# Altium schematic sheet 200_DC-DC.SchDoc: DC-DC Convertion stages
size A3; Date: xxxxxx; DrawnBy: H.Y.Pabón; Revision: V1R0; SheetNumber: 3; SheetTotal: 4
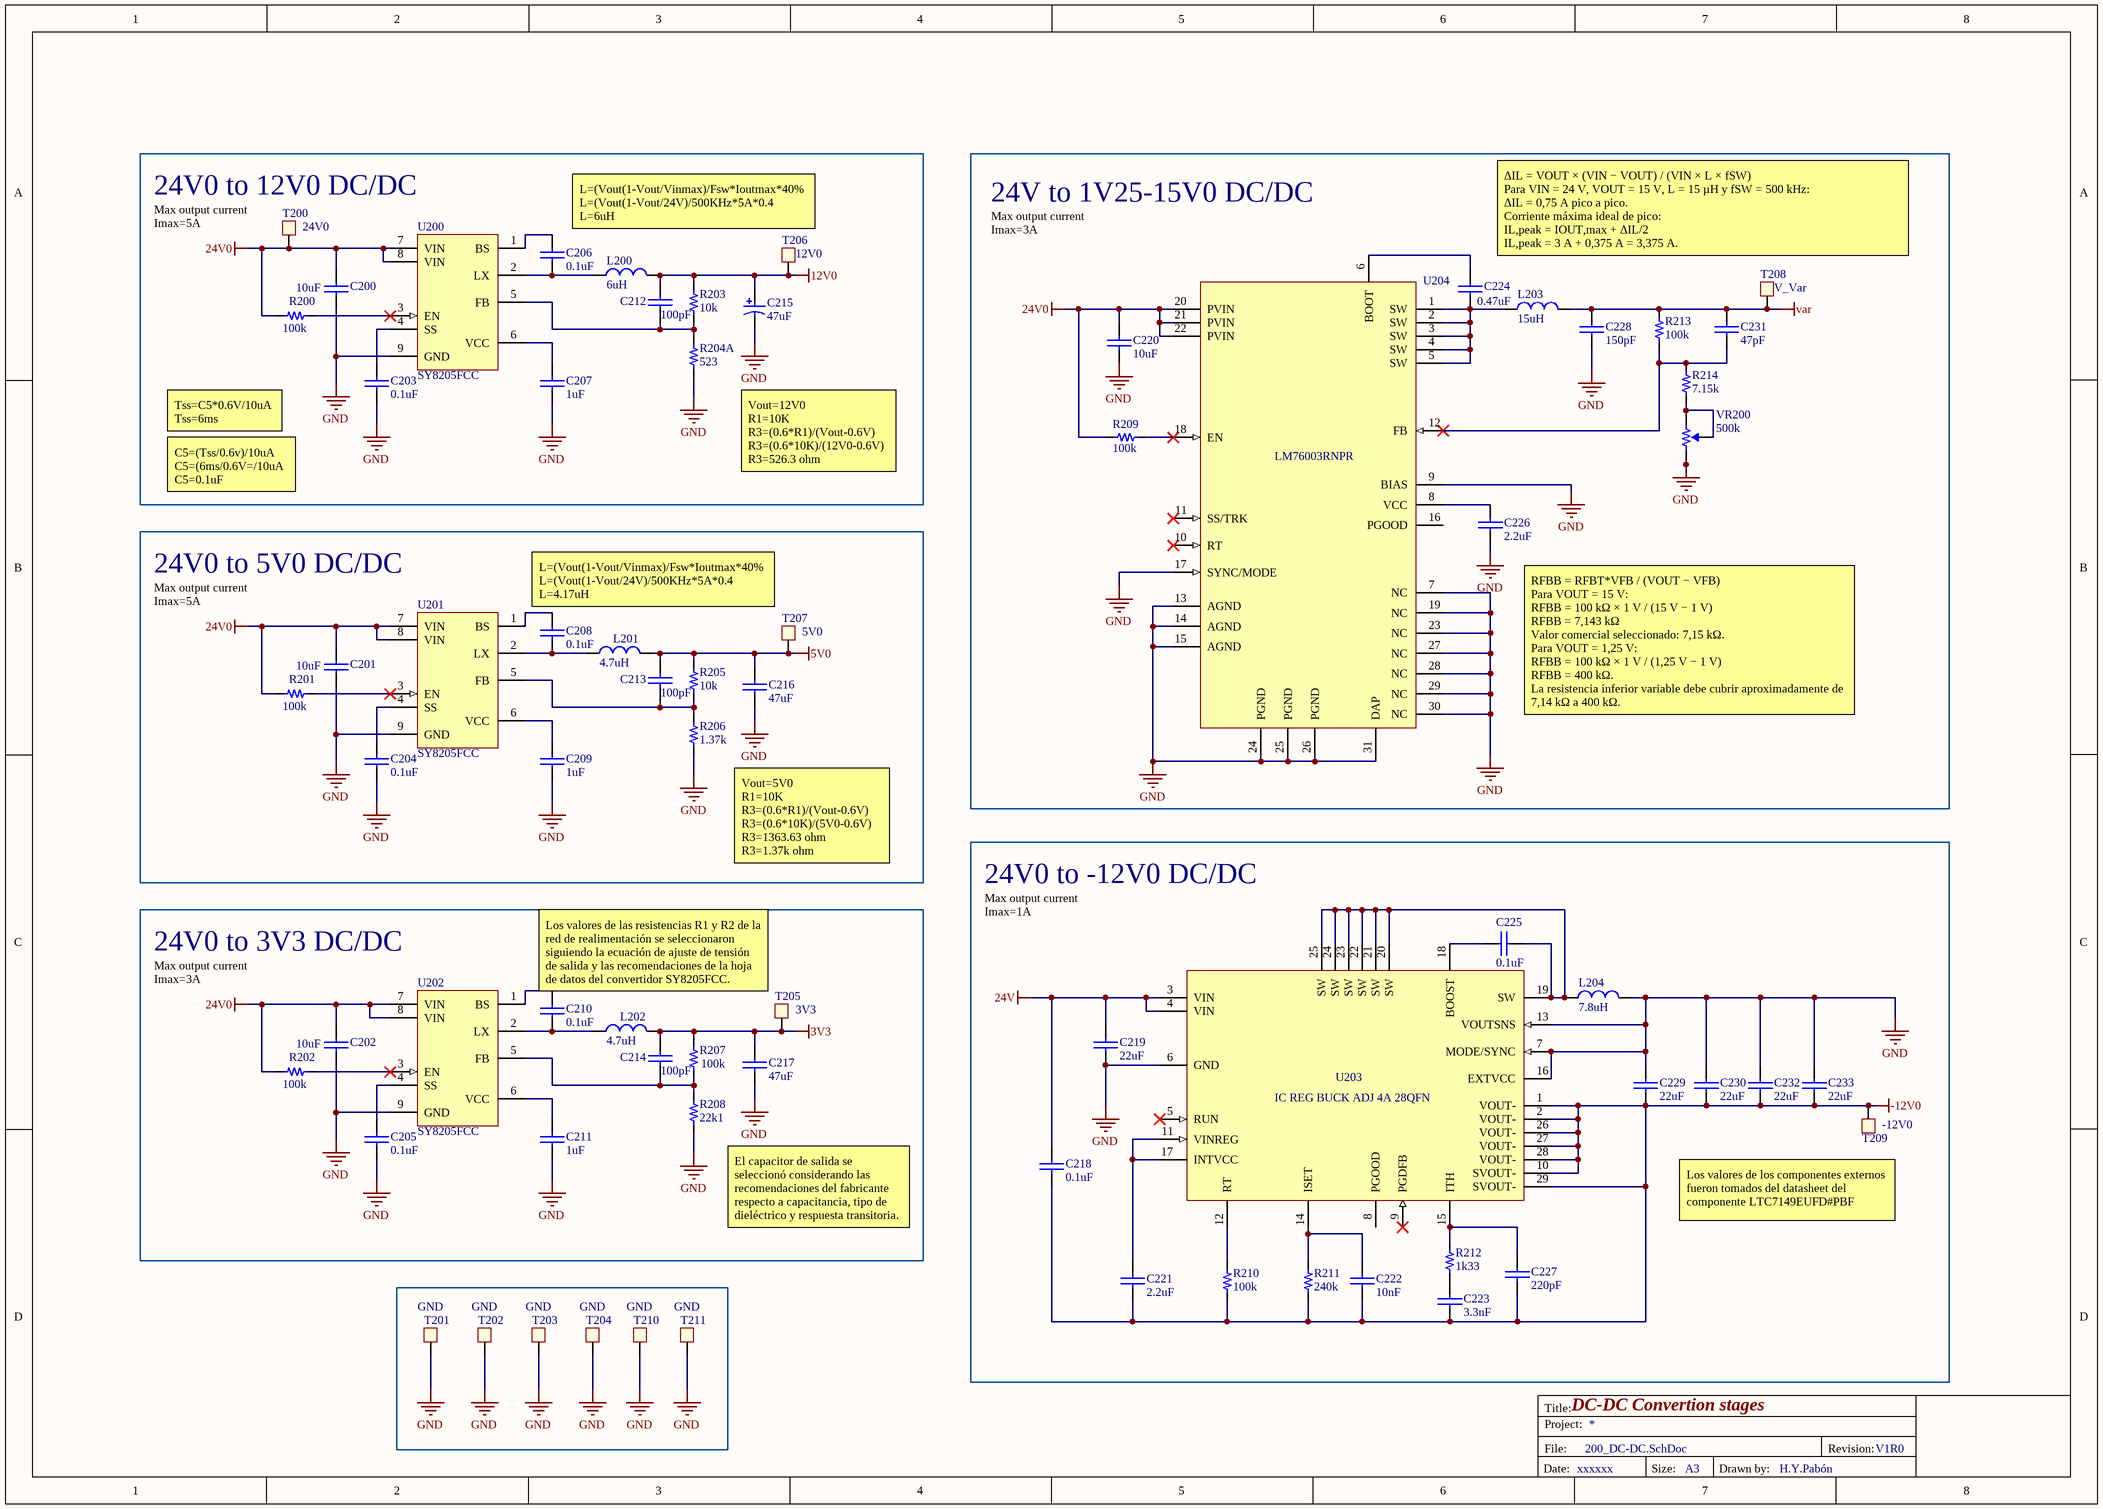
[diagram p0: 200_DC-DC.SchDoc]

## Parts
C200  value 10uF  [1206]  (hidden comment: 10uF 50V)
C201  value 10uF  [1206]  (hidden comment: 10uF 50V)
C202  value 10uF  [1206]  (hidden comment: 10uF 50V)
C203  value 0.1uF  [0603]  (hidden comment: 100nF 25V)
C204  value 0.1uF  [0603]  (hidden comment: 100nF 25V)
C205  value 0.1uF  [0603]  (hidden comment: 100nF 25V)
C206  value 0.1uF  [0603]  (hidden comment: 100nF 25V)
C207  value 1uF  [0805]  (hidden comment: 1uF 25V)
C208  value 0.1uF  [0603]  (hidden comment: 100nF 25V)
C209  value 1uF  [0805]  (hidden comment: 1uF 25V)
C210  value 0.1uF  [0603]  (hidden comment: 100nF 25V)
C211  value 1uF  [0805]  (hidden comment: 1uF 25V)
C212  value 100pF  [0603]  (hidden comment: 100pF 550)
C213  value 100pF  [0603]  (hidden comment: 100pF 550)
C214  value 100pF  [0603]  (hidden comment: 100pF 550)
C215  value 47uF  [RADIAL-CAN-SMD_Diax5mm_Hx6.1mm]  (hidden comment: 47uF 35V)
C216  value 47uF  [1210]  (hidden comment: 47uF 1210)
C217  value 47uF  [1210]  (hidden comment: 47uF 1210)
C218  value 0.1uF  [0402]  (hidden comment: 0.1uF 50V)
C219  value 22uF  [0805]  (hidden comment: 22uF 25V)
C220  value 10uF  [1206]  (hidden comment: 10uF 50V)
C221  2.2uF  [0402]
C222  value 10nF  [0603]  (hidden comment: 10nF 50V)
C223  value 3.3nF  [Cap_3.3nF_25V_X7R0603]  (hidden comment: 3.3nF_25V)
C224  value 0.47uF  [0603]  (hidden comment: 0.47uF 25V)
C225  value 0.1uF  [0402]  (hidden comment: 0.1uF 50V)
C226  2.2uF  [0402]
C227  value 220pF  [0402_RF]  (hidden comment: 220pF 50V)
C228  value 150pF  [0603]  (hidden comment: 150pF 50V)
C229  value 22uF  [1210]  (hidden comment: 22uF 25V)
C230  value 22uF  [1210]  (hidden comment: 22uF 25V)
C231  value 47pF  [0603]  (hidden comment: 47pF 16V)
C232  value 22uF  [1210]  (hidden comment: 22uF 25V)
C233  value 22uF  [1210]  (hidden comment: 22uF 25V)
L200  value 6uH  [L_6uH_9.5A_SMD,13x12.8mm]  (hidden comment: 6uH_9.5A)
L201  value 4.7uH  [L_4.7uH_7A_SMD]  (hidden comment: 4.7uH_5A)
L202  value 4.7uH  [L_4.7uH_7A_SMD]  (hidden comment: 4.7uH_7A)
L203  value 15uH  [L_15uH_4.5A_SMD,12.3x12.3mm]  (hidden comment: SMDRI127-150MT)
L204  value 7.8uH  [L_7.8uH_8A_SMD,10.5x10.2mm]  (hidden comment: 7.8uH_8A)
R200  value 100k  [0402]  (hidden comment: 100K 1/16W)
R201  value 100k  [0402]  (hidden comment: 100K 1/16W)
R202  value 100k  [0402]  (hidden comment: 100K 1/16W)
R203  value 10k  [0402]  (hidden comment: 10k 1/16W)
R204  value 523  [Res_523_SMD0805_130mW]  (hidden comment: 523 OHM_130mW)  (part A of 2)
R205  value 10k  [0402]  (hidden comment: 10k 1/16W)
R206  value 1.37k  [Res_1.37k_0402_100mW]  (hidden comment: 1.37k_100mW)
R207  value 100k  [0402]  (hidden comment: 100K 1/16W)
R208  value 22k1  [0603]  (hidden comment: 22k1 1/10W)
R209  value 100k  [0805]  (hidden comment: 100k 1/8W)
R210  value 100k  [0402]  (hidden comment: 100K 1/16W)
R211  value 240k  [0603]  (hidden comment: 240k 1/10W)
R212  value 1k33  [0603]  (hidden comment: 1k33 1/10W)
R213  value 100k  [0603]  (hidden comment: 100k 1/10W)
R214  value 7.15k  [RES 7.15k_SMD-0603]  (hidden comment: MCR03EZPFX7151)
T200  24V0  [TP_TH_30mil]  (no BOM)
T201  GND  [TP_TH_30mil]  (no BOM)
T202  GND  [TP_TH_30mil]  (no BOM)
T203  GND  [TP_TH_30mil]  (no BOM)
T204  GND  [TP_TH_30mil]  (no BOM)
T205  3V3  [TP_TH_30mil]  (no BOM)
T206  12V0  [TP_TH_30mil]  (no BOM)
T207  5V0  [TP_TH_30mil]  (no BOM)
T208  V_Var  [TP_TH_30mil]  (no BOM)
T209  -12V0  [TP_TH_30mil]  (no BOM)
T210  GND  [TP_TH_30mil]  (no BOM)
T211  GND  [TP_TH_30mil]  (no BOM)
U200  SY8205FCC  [SOIC127P600X140_HS-9N]
U201  SY8205FCC  [SOIC127P600X140_HS-9N]
U202  SY8205FCC  [SOIC127P600X140_HS-9N]
U203  IC REG BUCK ADJ 4A 28QFN  [IC REG BUCK ADJ 4A 28QFN]
U204  LM76003RNPR  [DCDC_ADJ_3.5A_WQFN-30-EP(4x6)]
VR200  value 500k  [Pot_3x1_5mm_TH]  (hidden comment: 500k 1/5W)

## Blocks framed on the sheet
24V0 to 12V0 DC/DC: C200 C203 C206 C207 C212 C215 L200 R200 R203 R204 T200 T206 U200
24V to 1V25-15V0 DC/DC: C220 C224 C226 C228 C231 L203 R209 R213 R214 T208 U204 VR200
24V0 to 5V0 DC/DC: C201 C204 C208 C209 C213 C216 L201 R201 R205 R206 T207 U201
24V0 to -12V0 DC/DC: C218 C219 C221-C223 C225 C227 C229 C230 C232 C233 L204 R210-R212 T209 U203
24V0 to 3V3 DC/DC: C202 C205 C210 C211 C214 C217 L202 R202 R207 R208 T205 U202

## Nets
3V3: C214.1 C217.1 L202.2 R207.2 T205.1
5V0: C213.1 C216.1 L201.2 R205.2 T207.1
12V0: C212.1 C215.1 L200.2 R203.2 T206.1
24V: C218.1 C219.1 U203.3(VIN) U203.4(VIN)
24V0: C200.1 C201.1 C202.1 C220.1 R200.1 R201.1 R202.1 R209.2 T200.1 U200.7(VIN) U200.8(VIN) U201.7(VIN) U201.8(VIN) U202.7(VIN) U202.8(VIN) U204.20(PVIN) U204.21(PVIN) U204.22(PVIN)
-12V0: C218.2 C221.2 C222.2 C223.2 C227.2 C229.2 C230.2 C232.2 C233.2 R210.1 R211.1 T209.1 U203.1(VOUT-) U203.2(VOUT-) U203.10(SVOUT-) U203.26(VOUT-) U203.27(VOUT-) U203.28(VOUT-) U203.29(SVOUT-)
GND: C200.2 C201.2 C202.2 C203.2 C204.2 C205.2 C207.2 C209.2 C211.2 C215.2 C216.2 C217.2 C219.2 C220.2 C226.2 C228.2 C229.1 C230.1 C232.1 C233.1 L204.2 R204.1 R206.1 R208.1 T201.1 T202.1 T203.1 T204.1 T210.1 T211.1 U200.9(GND) U201.9(GND) U202.9(GND) U203.6(GND) U203.7(MODE/SYNC) U203.13(VOUTSNS) U203.16(EXTVCC) U204.7(NC) U204.9(BIAS) U204.13(AGND) U204.14(AGND) U204.15(AGND) U204.17(SYNC/MODE) U204.19(NC) U204.23(NC) U204.24(PGND) U204.25(PGND) U204.26(PGND) U204.27(NC) U204.28(NC) U204.29(NC) U204.30(NC) U204.31(DAP) VR200.3
var: C228.1 C231.1 L203.2 R213.2 T208.1
NetC203_1: C203.1 U200.4(SS)
NetC204_1: C204.1 U201.4(SS)
NetC205_1: C205.1 U202.4(SS)
NetC206_1: C206.1 U200.1(BS)
NetC206_2: C206.2 L200.1 U200.2(LX)
NetC207_1: C207.1 U200.6(VCC)
NetC208_1: C208.1 U201.1(BS)
NetC208_2: C208.2 L201.1 U201.2(LX)
NetC209_1: C209.1 U201.6(VCC)
NetC210_1: C210.1 U202.1(BS)
NetC210_2: C210.2 L202.1 U202.2(LX)
NetC211_1: C211.1 U202.6(VCC)
NetC212_2: C212.2 R203.1 R204.2 U200.5(FB)
NetC213_2: C213.2 R205.1 R206.2 U201.5(FB)
NetC214_2: C214.2 R207.1 R208.2 U202.5(FB)
NetC221_1: C221.1 U203.11(VINREG) U203.17(INTVCC)
NetC222_1: C222.1 R211.2 U203.14(ISET)
NetC223_1: C223.1 R212.1
NetC224_1: C224.1 L203.1 U204.1(SW) U204.2(SW) U204.3(SW) U204.4(SW) U204.5(SW)
NetC224_2: C224.2 U204.6(BOOT)
NetC225_1: C225.1 U203.18(BOOST)
NetC225_2: C225.2 L204.1 U203.19(SW) U203.20(SW) U203.21(SW) U203.22(SW) U203.23(SW) U203.24(SW) U203.25(SW)
NetC226_1: C226.1 U204.8(VCC)
NetC227_1: C227.1 R212.2 U203.15(ITH)
NetC231_2: C231.2 R213.1 R214.2 U204.12(FB)
NetR200_2: R200.2 U200.3(EN)
NetR201_2: R201.2 U201.3(EN)
NetR202_2: R202.2 U202.3(EN)
NetR209_1: R209.1 U204.18(EN)
NetR210_2: R210.2 U203.12(RT)
NetR214_1: R214.1 VR200.1 VR200.2

Not connected (* = marked no-connect by the designer): U203 5(RUN)* 8(PGOOD) 9(PGDFB)*; U204 10(RT)* 11(SS/TRK)* 16(PGOOD)

## Notes on the sheet
- (near T200) Max output current
  Imax=5A
- L=(Vout(1-Vout/Vinmax)/Fsw*Ioutmax*40%
  L=(Vout(1-Vout/24V)/500KHz*5A*0.4
  L=6uH
- Max output current
  Imax=3A
- ΔIL = VOUT × (VIN − VOUT) / (VIN × L × fSW)
  Para VIN = 24 V, VOUT = 15 V, L = 15 µH y fSW = 500 kHz:
  ΔIL = 0,75 A pico a pico.
  Corriente máxima ideal de pico:
  IL,peak = IOUT,max + ΔIL/2
  IL,peak = 3 A + 0,375 A = 3,375 A.
- Tss=C5*0.6V/10uA
  Tss=6ms
  Css=0.1uF
- C5=(Tss/0.6v)/10uA
  C5=(6ms/0.6V=/10uA
  C5=0.1uF
- Vout=12V0
  R1=10K
  R3=(0.6*R1)/(Vout-0.6V)
  R3=(0.6*10K)/(12V0-0.6V)
  R3=526.3 ohm
- Max output current
  Imax=5A
- (near C208) L=(Vout(1-Vout/Vinmax)/Fsw*Ioutmax*40%
  L=(Vout(1-Vout/24V)/500KHz*5A*0.4
  L=4.17uH
- (near C226) RFBB = RFBT*VFB / (VOUT − VFB)
  Para VOUT = 15 V:
  RFBB = 100 kΩ × 1 V / (15 V − 1 V)
  RFBB = 7,143 kΩ
  Valor comercial seleccionado: 7,15 kΩ.
  Para VOUT = 1,25 V:
  RFBB = 100 kΩ × 1 V / (1,25 V − 1 V)
  RFBB = 400 kΩ.
  La resistencia inferior variable debe cubrir aproximadamente de 7,14 kΩ a 400 kΩ.
- Vout=5V0
  R1=10K
  R3=(0.6*R1)/(Vout-0.6V)
  R3=(0.6*10K)/(5V0-0.6V)
  R3=1363.63 ohm
  R3=1.37k ohm
- Max output current
  Imax=1A
- (near C210) Los valores de las resistencias R1 y R2 de la red de realimentación se seleccionaron siguiendo la ecuación de ajuste de tensión de salida y las recomendaciones de la hoja de datos del convertidor SY8205FCC.
- (near R208) El capacitor de salida se seleccionó considerando las recomendaciones del fabricante respecto a capacitancia, tipo de dieléctrico y respuesta transitoria.
- (near T209) Los valores de los componentes externos fueron tomados del datasheet del componente LTC7149EUFD#PBF
- Title:
- Project:
- File:
- Revision:
- Date:
- Size:
- A3
- Drawn by:

## Library data of the parts
C200-C202 C220 = Cap_10uF_1206_50V: CAP CER 10UF 50V X5R 1206; Manufacturer: Murata Electronics North America; Manufacturer Part Number: GRT31CR61H106ME01L; Last modified by: J.Jaramillo; Last modified date: 20240309; ComponentLink1Description: Digi-Key; ComponentLink1URL: https://www.digikey.com/product-detail/en/murata-electronics-north-america/GRT31CR61H106ME01L/490-12457-1-ND/5417158; Supplier 1: Digi-Key; Supplier Part Number 1: 490-12457-1-ND
C203-C206 C208 C210 = Cap_0.1uF_0603_25V: CAP CER 0.1UF 25V X7R 0603; Manufacturer: TDK; Manufacturer Part Number: CGA3E2X7R1E104K080AA; Last modified by: J.Jaramillo; Last modified date: 20240309; ComponentLink1Description: Digi-key; ComponentLink1URL: https://www.digikey.com/en/products/detail/tdk-corporation/CGA3E2X7R1E104K080AA/2443145?s=N4IgTCBcDaIMIHECCBmAomAGgdgEoEY18AGAFgGliAOYpJEAXQF8g; Supplier 1: Digi-Key; Supplier Part Number 1: 445-5667-1-ND
C207 C209 C211 = Cap_1uF_0805_25V: CAP CER 1UF 25V X7R 0805; Manufacturer: Yageo; Manufacturer Part Number: CC0805KKX7R8BB105; Supplier 1: Digi-Key; Supplier Part Number 1: 311-1456-1-ND; Last modified by: J.Jaramillo; Last modified date: 20240309; ComponentLink1Description: Digi-Key; ComponentLink1URL: https://www.digikey.com/product-detail/en/yageo/CC0805KKX7R8BB105/311-1456-1-ND/2833762
C212-C214 = Cap_100pF_0603_50V: CAP CER 100PF 50V C0G/NPO 0603; Manufacturer Part Number: CC0603JRNPO9BN101; Manufacturer: Yageo; Last modified by: J.Jaramillo; Last modified date: 20240309; ComponentLink1Description: Digi-key; ComponentLink1URL: https://www.digikey.com/en/products/detail/yageo/CC0603JRNPO9BN101/302803?s=N4IgTCBcDaIMwEYEFoEAYBsBOVyByAIiALoC%2BQA; Reel stock: N/A; Supplier 1: Digi-Key; Supplier Part Number 1: 311-1069-1-ND
C215 = Cap_47uF_35V_ALU_SMD: CAP ALUM 47UF 20% 35V SMD; Manufacturer: Panasonic Electronic Components; Manufacturer Part Number: EEEFT1V470AR; Last modified by: J.Jaramillo; Last modified date: 20240309; ComponentLink1Description: Digi-Key; ComponentLink1URL: https://www.digikey.com/product-detail/en/panasonic-electronic-components/EEE-FT1V470AR/PCE5014CT-ND/2652069; Supplier 1: Digi-Key; Supplier Part Number 1: PCE5014CT-ND
C216 C217 = Cap_47uF_1210_16V_1: CAP CER 47UF 16V X5R 1210; Manufacturer: Taiyo Yuden; Manufacturer Part Number: EMK325BJ476MM-T; Supplier 1: Digi-Key; Supplier Part Number 1: 587-1436-1-ND; Last modified by: J.Jaramillo; Last modified date: 20240309; ComponentLink1Description: Digi-Key; ComponentLink1URL: https://www.digikey.com/en/products/detail/taiyo-yuden/EMK325BJ476MM-T/1004067
C218 C225 = Cap_0.1uF_0402_50V: CAP CER 0.1UF 50V X7R 0402; Manufacturer: Samsung Electro-Mechanics; Manufacturer Part Number: CL05B104KB54PNC; Supplier 1: Digi-Key; Supplier Part Number 1: 1276-CL05B104KB54PNCCT-ND; Last modified by: J.Jaramillo; Last modified date: 20240309; ComponentLink1Description: Digi-Key; ComponentLink1URL: https://www.digikey.com/en/products/detail/samsung-electro-mechanics/CL05B104KB54PNC/11487801?s=N4IgTCBcDaIMIBkAMBWAQgRiQFgNJpWwAUA5OEAXQF8g
C219 = Cap_22uF_0805_25V: CAP CER 22UF 25V X5R 0805; Manufacturer: Samsung Electro-Mechanics; Manufacturer Part Number: CL21A226MAYNNNE; Supplier 1: Digi-Key; Supplier Part Number 1: 1276-CL21A226MAYNNNECT-ND; Last modified by: J.Jaramillo; Last modified date: 20240309; ComponentLink1Description: Digi-Key; ComponentLink1URL: https://www.digikey.com/en/products/detail/samsung-electro-mechanics/CL21A226MAYNNNE/10479857
C221 C226 = Cap_2.2uF_0402_10V: CAP CER 2.2UF 10V X5R 0402; Manufacturer: Yageo; Manufacturer Part Number: CC0402KRX5R6BB225; Supplier 1: Digikey; Supplier Part Number 1: 311-1686-1-ND; Last modified by: J.Jaramillo; Last modified date: 20240309; ComponentLink1Description: Digikey; ComponentLink1URL: https://www.digikey.com/en/products/detail/yageo/CC0402KRX5R6BB225/5195095; Value: 2.2uF
C222 = Cap_10000pF_0603_50V: CAP CER 10000PF 50V X7R 0603; Manufacturer: Yageo; Manufacturer Part Number: CC0603JRX7R9BB103; Supplier 1: Digi-Key; Supplier Part Number 1: 311-1778-1-ND; Reel stock: N/A; Last modified by: J.Jaramillo; Last modified date: 20240309; ComponentLink1Description: Digi-key; ComponentLink1URL: https://www.digikey.com/en/products/detail/yageo/CC0603JRX7R9BB103/5195187
C223 = Cap_3.3nF_25V_X7R0603: CAP CER 3.3nF 25V X7R 0603; Manufacturer: YAGEO; Manufacturer Part Number: CC0603KRX7R8BB332; Supplier 1: LCSC; Supplier Part Number 1: C519423; Reel stock: N/A; Last modified by: H.Y.Pabón; Last modified date: 20261028; ComponentLink1Description: LCSC; ComponentLink1URL: https://www.lcsc.com/es/product-detail/C519423.html?s_z=n_q_t_capacitor%25203.3nF&spm=wm.fly.bg.14.xh___wm.ssy.tc.0.tz&lcsc_vid=FllXAlYHRVNaVVBUTlhdBgZUE1dfAlNXEVBWXlEAFVYxVlNfRFNdUlNVQFdcXjsOAxUeFF5JWBYZEEoKFBINSQcJGk4LFEsFFhULAAsUDk5fVlxXWQkaCgg%3D; ComponentLink2Description: DataSheet; ComponentLink2URL: https://www.lcsc.com/datasheet/C519423.pdf?spm=wm.sxq.inf.ggs___wm.fly.bg.14.xh&lcsc_vid=FllXAlYHRVNaVVBUTlhdBgZUE1dfAlNXEVBWXlEAFVYxVlNfRFNdUlNVQFdcXjsOAxUeFF5JWBYZEEoKFBINSQcJGk4LFEsFFhULAAsUDk5fVlxXWQkaCgg%3D
C224 = Cap_0.47uF_0603_25V: CAP CER 0.47UF 25V X7R 0603; Manufacturer: Walsin Technologies; Manufacturer Part Number: 0603B474K250CT; Last modified by: J.Jaramillo; Last modified date: 20240309; ComponentLink1Description: Digi-key; ComponentLink1URL: https://www.digikey.com/en/products/detail/walsin-technology-corporation/0603B474K250CT/9354949?s=N4IgTCBcDaIAwDY4GYBCAWA7Og0mArHAMIAqIAugL5A; Supplier 1: Digi-Key; Supplier Part Number 1: 1292-1452-1-ND
C227 = Cap_220pF_0402_50V: CAP CER 220PF 50V C0G/NP0 0402; Manufacturer: Murata Electronics; Manufacturer Part Number: GCM1555C1H221JA16D; Supplier 1: Digi-key; Supplier Part Number 1: 490-4927-1-ND; Last modified by: J.Jaramillo; Last modified date: 20240309; ComponentLink1Description: Digi-key; ComponentLink1URL: https://www.digikey.com/en/products/detail/murata-electronics/GCM1555C1H221JA16D/1765175
C228 = Cap_150pF_0603_50V: CAP CER 150PF 50V X7R 0603; Manufacturer: Samsung Electro-Mechanics; Manufacturer Part Number: CL10B151KB8NNNC; Supplier 1: Digi-Key; Supplier Part Number 1: 1276-1956-1-ND; Reel stock: N/A; Last modified by: J.Jaramillo; Last modified date: 20240309; ComponentLink1Description: Digi-Key; ComponentLink1URL: https://www.digikey.com/product-detail/en/samsung-electro-mechanics/CL10B151KB8NNNC/1276-1956-1-ND/3890042
C229 C230 C232 C233 = Cap_22uF_1210_25V: CAP CER 22UF 25V X5R 1210; Manufacturer: KYOCERA AVX; Manufacturer Part Number: 12103D226KAT2A; Supplier 1: Digi-Key; Supplier Part Number 1: 478-5999-1-ND; Last modified by: J.Jaramillo; Last modified date: 20240309; ComponentLink1Description: Digi-Key; ComponentLink1URL: https://www.digikey.com/en/products/detail/kyocera-avx/12103D226KAT2A/2208898?s=N4IgTCBcDaIIxjgBgMwBExgGwGkCCAKmHiALoC%2BQA
C231 = Cap_47pF_0603_50V: CAP CER 47PF 50V C0G/NP0 0603; Manufacturer: Yageo; Manufacturer Part Number: CC0603JRNPO9BN470; Last modified by: J.Jaramillo; Last modified date: 20240309; ComponentLink1Description: Digi-Key; ComponentLink1URL: https://www.digikey.com/en/products/detail/yageo/CC0603JRNPO9BN470/302799?s=N4IgTCBcDaIMJwAwDZEGYBSAlAcgBQHkBOAIRwBYB2REAXQF8g; Supplier 1: Digi-Key; Supplier Part Number 1: 311-1065-1-ND
L200 = L_6uH_9.5A_SMD,13x12.8mm: 9.5A 6uH ±20% 11.5A 14.85mΩ Molded inductor SMD,13x12.8mm Fixed Inductors; Manufacturer: Coilank; Manufacturer Part Number: APZBX1250M6R0; Supplier 1: LCSC; Supplier Part Number 1: C54623474; Reel Stock: N/A; Last modified by: H.Y.Pabón; Last modified date: 20261023; ComponentLink1Description: LCSC; ComponentLink1URL: https://www.lcsc.com/es/product-detail/C54623474.html?s_z=n_q_Coilank%2520APZBX1250M6R0&spm=wm.fly.bg.0.xh&lcsc_vid=QFZYVlcFRFBZAlcDFVQLVVBXQlJZV1IFTlhYAQVfQlcxVlNfRVleVlVTQVJZUDsOAxUeFF5JWBYZEEoKFBINSQcJGk4LFEsFFhULAAsUDk5fVl1fWQkaCgg%3D; ComponentLink2Description: DataSheet; ComponentLink2URL: https://www.lcsc.com/datasheet/C54623474.pdf?spm=wm.sxq.inf.ggs___wm.fly.bg.0.xh&lcsc_vid=QFZYVlcFRFBZAlcDFVQLVVBXQlJZV1IFTlhYAQVfQlcxVlNfRVleVlVTQVJZUDsOAxUeFF5JWBYZEEoKFBINSQcJGk4LFEsFFhULAAsUDk5fVl1fWQkaCgg%3D
L201 L202 = L_4.7uH_7A_SMD: Inductores de potencia - SMD WE-PD 4.7uH 7A DCR=12.4mOhms AEC-Q200; Manufacturer: Wurth Elektronik; Manufacturer Part Number: 7447714047; Supplier 1: MOUSER; Supplier Part Number 1: 710-7447714047; Reel Stock: N/A; Last modified by: H.Y.Pabón; Last modified date: 20261024; ComponentLink1Description: MOUSER; ComponentLink1URL: https://co.mouser.com/es/ProductDetail/Wurth-Elektronik/7447714047?qs=XJfXErqHgA5CSKkgffrfLQ%3D%3D; ComponentLink2Description: DataSheet; ComponentLink2URL: https://www.we-online.com/components/products/datasheet/7447714047.pdf
L203 = L_15uH_4.5A_SMD,12.3x12.3mm: FIXED IND 15uH 4.5A 27mΩ SMD,12.3x12.3mm; Manufacturer: Shun Xiang Nuo; Manufacturer Part Number: SMDRI127-150MT; Supplier 1: LCSC; Supplier Part Number 1: C40000; Reel Stock: N/A; Last modified by: H.Y.Pabón; Last modified date: 20261027; ComponentLink1Description: LCSC; ComponentLink1URL: https://www.lcsc.com/es/product-detail/C40000.html?s_z=n_q_t_inductor%252015uH&spm=wm.fly.bg.29.xh___wm.ssy.tc.0.tz&lcsc_vid=QlNYUQJQTlJZUFMERVVXUwJeTwJcUQUCFFBfX1MHEQAxVlNfRFBaVFVeRVFcUjsOAxUeFF5JWBYZEEoKFBINSQcJGk4LFEsVEgAcBAw%3D; ComponentLink2Description: DataSheet; ComponentLink2URL: https://www.lcsc.com/datasheet/C40000.pdf
L204 = L_7.8uH_8A_SMD,10.5x10.2mm: FIXED IND 7.8uH 8A 13.6mΩ SMD,10.2x10.5mm; Manufacturer: KOHERelec; Manufacturer Part Number: FHC1050-7R8M; Supplier 1: LCSC; Supplier Part Number 1: C2761921; Reel Stock: N/A; Last modified by: H.Y.Pabón; Last modified date: 20261028; ComponentLink1Description: LCSC; ComponentLink1URL: https://www.lcsc.com/es/product-detail/C2761921.html?s_z=n_q_inductor%25207.8uH&spm=wm.fly.bg.3.xh&lcsc_vid=FllXAlYHRVNaVVBUTlhdBgZUE1dfAlNXEVBWXlEAFVYxVlNfRFNdVV1XQVBeVzsOAxUeFF5JWBYZEEoKFBINSQcJGk4LFEsFFhULAAsUDk5fVlxXWQkaCgg%3D; ComponentLink2Description: DataSheet; ComponentLink2URL: https://www.lcsc.com/datasheet/C2761921.pdf?spm=wm.sxq.inf.ggs___wm.fly.bg.3.xh&lcsc_vid=FllXAlYHRVNaVVBUTlhdBgZUE1dfAlNXEVBWXlEAFVYxVlNfRFNdVV1XQVBeVzsOAxUeFF5JWBYZEEoKFBINSQcJGk4LFEsFFhULAAsUDk5fVlxXWQkaCgg%3D
R200-R202 R207 R210 = Res_100k_0402_1/16W: RES SMD 100K OHM 1% 1/16W 0402; Manufacturer: Yageo; Manufacturer Part Number: RC0402FR-07100KL; Supplier 1: Digi-Key; Supplier Part Number 1: 311-100KLRCT-ND; Reel Stock: N/A; Last modified by: J.Jaramillo; Last modified date: 20240310; ComponentLink1Description: Digi-Key; ComponentLink1URL: https://www.digikey.com/en/products/detail/yageo/RC0402FR-07100KL/726526?s=N4IgTCBcDaIEoGEAMAWJYBicC0SDsAjEkgNIAyIAugL5A
R203 R205 = Res_10k_0402_1/16W: RES SMD 10K OHM 1% 1/16W 0402; Manufacturer: Yageo; Manufacturer Part Number: RC0402FR-0710KL; Supplier 1: Digi-Key; Supplier Part Number 1: 311-10.0KLRCT-ND; Reel Stock: N/A; Last modified by: J.Jaramillo; Last modified date: 20240310; ComponentLink1Description: Digi-Key; ComponentLink1URL: https://www.digikey.com/en/products/detail/yageo/RC0402FR-0710KL/726523?s=N4IgTCBcDaIEoGEAMAWJYBicC0SDsAjEgNIAyIAugL5A
R204 = Res_523_SMD0805_130mW: RES 523Ω ±0.1% 130mW 0805; Manufacturer: RESI; Manufacturer Part Number: PTFR0805B523RN9; Supplier 1: LCSC; Supplier Part Number 1: C47116002; Reel Stock: N/A; Last modified by: H.Y.Pabón; Last modified date: 20261023; ComponentLink1Description: LCSC; ComponentLink1URL: https://www.lcsc.com/es/product-detail/C47116002.html?s_z=n_q_t_resistor%2520523&spm=wm.fly.bg.3.xh___wm.ssy.tc.0.tz&lcsc_vid=QFZYVlcFRFBZAlcDFVQLVVBXQlJZV1IFTlhYAQVfQlcxVlNfRVZXUFxSQVRdVTsOAxUeFF5JWBYZEEoKFBINSQcJGk4LFEsFFhULAAsUDk5fVl1fWQkaCgg%3D; ComponentLink2Description: DataSheet; ComponentLink2URL: https://www.lcsc.com/datasheet/C47116002.pdf?spm=wm.sxq.inf.ggs___wm.fly.bg.3.xh&lcsc_vid=QFZYVlcFRFBZAlcDFVQLVVBXQlJZV1IFTlhYAQVfQlcxVlNfRVZXUFxSQVRdVTsOAxUeFF5JWBYZEEoKFBINSQcJGk4LFEsFFhULAAsUDk5fVl1fWQkaCgg%3D
R206 = Res_1.37k_0402_100mW: RES 1.37kΩ ±1% 100mW 0402; Manufacturer: PANASONIC; Manufacturer Part Number: ERJ2RKF1371X; Supplier 1: LCSC; Supplier Part Number 1: C3025701; Reel Stock: N/A; Last modified by: H.Y.Pabón; Last modified date: 20261023; ComponentLink1Description: LCSC; ComponentLink1URL: https://www.lcsc.com/es/product-detail/C3025701.html?s_z=n_q_t_resistor%25201.37K&spm=wm.fly.bg.5.xh___wm.ssy.tc.0.tz&lcsc_vid=QFZYVlcFRFBZAlcDFVQLVVBXQlJZV1IFTlhYAQVfQlcxVlNfRVleX1FeRFFaUTsOAxUeFF5JWBYZEEoKFBINSQcJGk4LFEsFFhULAAsUDk5fVlxXWQkaCgg%3D; ComponentLink2Description: DataSheet; ComponentLink2URL: https://www.lcsc.com/datasheet/C3025701.pdf?spm=wm.sxq.inf.ggs___wm.fly.bg.5.xh&lcsc_vid=QFZYVlcFRFBZAlcDFVQLVVBXQlJZV1IFTlhYAQVfQlcxVlNfRVleX1FeRFFaUTsOAxUeFF5JWBYZEEoKFBINSQcJGk4LFEsFFhULAAsUDk5fVlxXWQkaCgg%3D
R208 = Res_22k1_0603_1/10W: RES 22.1K OHM 1% 1/10W 0603; Manufacturer: YAGEO; Manufacturer Part Number: RC0603FR-0722K1L; Supplier 1: Digi-Key; Supplier Part Number 1: 311-22.1KHRCT-ND; Reel Stock: N/A; Last modified by: J.Jaramillo; Last modified date: 20240310; ComponentLink1Description: Digi-Key; ComponentLink1URL: https://www.digikey.com/en/products/detail/yageo/RC0603FR-0722K1L/727058?s=N4IgTCBcDaIEoGEAMA2JBmAYnAtEg7GGANICMAMiALoC%2BQA
R209 = Res_100k_0805_1/8W: RES SMD 100K OHM 1% 1/8W 0805; Manufacturer: Yageo; Manufacturer Part Number: RC0805FR-07100KL; Supplier 1: Digi-Key; Supplier Part Number 1: 311-100KCRCT-ND; Reel Stock: N/A; Last modified by: J.Jaramillo; Last modified date: 20240310; ComponentLink1Description: Digi-Key; ComponentLink1URL: https://www.digikey.com/product-detail/en/yageo/RC0805FR-07100KL/311-100KCRCT-ND/730491
R211 = Res_240k_0603_1/10W: RES SMD 240K OHM 1% 1/10W 0603; Manufacturer: Yageo; Manufacturer Part Number: RC0603FR-07240KL; Reel Stock: N/A; Last modified by: J.Jaramillo; Last modified date: 20240310; ComponentLink1Description: Digi-key; ComponentLink1URL: https://www.digikey.com/product-detail/en/yageo/RC0603FR-07240KL/311-240KHRCT-ND/730029; Supplier 1: Digi-Key; Supplier Part Number 1: 311-240KHRCT-ND
R212 = Res_1k33_0603_1/10W: RES SMD 1.33K OHM 1% 1/10W 0603; Manufacturer: Yageo; Manufacturer Part Number: RC0603FR-071K33L; Supplier 1: Digi-Key; Supplier Part Number 1: 311-1.33KHRCT-ND; Reel Stock: N/A; Last modified by: J.Jaramillo; Last modified date: 20240310; ComponentLink1Description: Digi-Key; ComponentLink1URL: https://www.digikey.com/product-detail/en/yageo/RC0603FR-071K33L/311-1-33KHRCT-ND/729806
R213 = Res_100k_0603_1/10W: RES 100k OHM 1% 1/10W 0603; Manufacturer: Stackpole Electronics Inc.; Manufacturer Part Number: RMCF0603FT100K; Supplier 1: Digi-Key; Supplier Part Number 1: RMCF0603FT100KCT-ND; Reel Stock: N/A; Last modified by: J.Jaramillo; Last modified date: 20240310; ComponentLink1Description: Digi-Key; ComponentLink1URL: https://www.digikey.com/product-detail/en/stackpole-electronics-inc/RMCF0603FT100K/RMCF0603FT100KCT-ND/1943118
R214 = Res_7.15k_SMD-0603_0.1W: RES 7.15kΩ ±1% 100mW 0603; Manufacturer: ROHM; Manufacturer Part Number: MCR03EZPFX7151; Supplier 1: LCSC; Supplier Part Number 1: C308303; Reel Stock: N/A; Last modified by: H.Y.Pabón; Last modified date: 20261028; ComponentLink1Description: LCSC; ComponentLink1URL: https://www.lcsc.com/es/product-detail/C308303.html?s_z=n_q_t_resistor%25207.15K&spm=wm.fly.bg.8.xh___wm.ssy.tc.0.tz&lcsc_vid=QlNYUQJQTlJZUFMERVVXUwJeTwJcUQUCFFBfX1MHEQAxVlNfRFNeUlBfTlhbUTsOAxUeFF5JWBYZEEoKFBINSQcJGk4LFEsFFhULAAsUDk5fVlxXWQkaCgg%3D; ComponentLink2Description: DataSheet; ComponentLink2URL: https://www.lcsc.com/datasheet/C308303.pdf?spm=wm.sxq.inf.ggs___wm.fly.bg.8.xh&lcsc_vid=QlNYUQJQTlJZUFMERVVXUwJeTwJcUQUCFFBfX1MHEQAxVlNfRFNeUlBfTlhbUTsOAxUeFF5JWBYZEEoKFBINSQcJGk4LFEsFFhULAAsUDk5fVlxXWQkaCgg%3D
T200-T211 = TP_TH_30mil: Test point 30mil hole size; Last modified by: J.Jaramillo; Last modified date: 20240310
U200-U202 = DCDC_ADJ_5A_SOIC_8-EP: High Efficiency Fast Response, 5A, 30V Input Synchronous Step Down Regulator; Manufacturer: Silergy; Manufacturer Part Number: SY8205FCC; Supplier 1: LCSC; Supplier Part Number 1: C111875; Reel Stock: N/A; Last modified by: H.Y.Pabón; Last modified date: 22102026; ComponentLink1Description: LCSC; ComponentLink1URL: https://www.lcsc.com/es/product-detail/C111875.html?s_z=h_q_SY8205FCC; ComponentLink2Description: DataSheet; ComponentLink2URL: https://www.lcsc.com/datasheet/C111875.pdf?spm=wm.sxq.inf.ggs&lcsc_vid=QVMKUVJTRwALUwZUQwddBlJRRlRXBVVVTwcKAgEHQQUxVlNfRVdWVlFTT1RbUDsOAxUeFF5JWBYZEEoKFBINSQcJGk4LFEsFFhULAAsUDk5fV1ZfWQkaCgg%3D
U203 = DCDC_ADJ-12V_4A_28-WFQFN: Reductor Reguladores de conmutación IC Negativo Ajuste 0V 1 Salida 4A Placa descubierta 28-WFQFN; Manufacturer: Analog Devices Inc.; Manufacturer Part Number: LTC7149EUFD#PBF; Supplier 1: DIGIKEY; Supplier Part Number 1: 505-LTC7149EUFD#PBF-ND; Reel Stock: N/A; Last modified by: H.Y.Pabón; Last modified date: 20261028; ComponentLink1Description: DIGIKEY; ComponentLink1URL: https://www.digikey.com/es/products/detail/analog-devices-inc/LTC7149EUFD-PBF/5965250?s=N4IgTCBcDaIDIBUDCB2AjAFgJwFECqAYgCIDEACgEIEgC6AvkA; ComponentLink2Description: DataSheet; ComponentLink2URL: https://www.analog.com/media/en/technical-documentation/data-sheets/7149fa.pdf
U204 = DCDC_ADJ_3.5A_WQFN-30-EP(4x6): 3.5-V to 60-V, 2.5-A/3.5-A Synchronous Step-Down Voltage Regulator; Manufacturer: TI; Manufacturer Part Number: LM76003RNPR; Supplier 1: LCSC; Supplier Part Number 1: C470958; Reel Stock: N/A; Last modified by: H.Y.Pabón; Last modified date: 20261027; ComponentLink1Description: LCSC; ComponentLink1URL: https://www.lcsc.com/es/product-detail/C470958.html?s_z=n_q_LM76003&spm=wm.fly.bg.0.xh&lcsc_vid=QFYKUlZeFgNbUQcDRgdXAlxeRQQMAgVWRFIMUlVSEgcxVlNfRFBcUFVUQlZbXzsOAxUeFF5JWBYZEEoKFBINSQcJGk4LFEs%3D; ComponentLink2Description: DataSheet; ComponentLink2URL: https://www.lcsc.com/datasheet/C470958.pdf?spm=wm.sxq.inf.ggs___wm.fly.bg.0.xh&lcsc_vid=QgdbVgdWEVMLUlVVRwdeVVcCFVcLVQFRRlhWUlFWQFUxVlNfRFFaUVZXQlFaVjsOAxUeFF5JWBYZEEoKFBINSQcJGk4LFEs%3D
VR200 = Pot_500k_1/5W_TH: POT 500K OHM 1/5W PLASTIC LINEAR; Manufacturer: TT Electronics/BI; Manufacturer Part Number: P160KN-0QC15B500K; Reel Stock: N/A; Last modified by: J.Jaramillo; Last modified date: 20240310; ComponentLink1Description: Digi-key; ComponentLink1URL: https://www.digikey.com/products/en?keywords=987-1304-ND; Supplier 1: Digi-Key; Supplier Part Number 1: 987-1304-ND